# Altium schematic sheet Power_Section.SchDoc
size A; DocumentNumber: 5; SheetNumber: 5; SheetTotal: 13
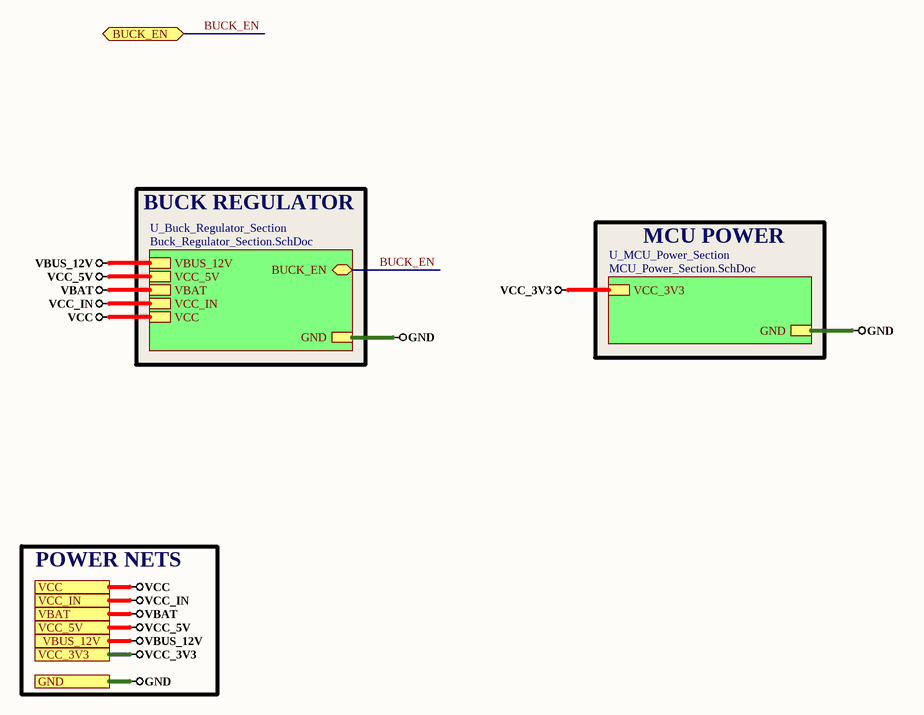
[diagram p0: Power_Section.SchDoc]

## Sub-sheets
U_Buck_Regulator_Section = Buck_Regulator_Section.SchDoc: GND, VBUS_12V, VCC_5V, VBAT, VCC_IN, VCC, BUCK_EN (bidir)
U_MCU_Power_Section = MCU_Power_Section.SchDoc: VCC_3V3, GND

## Ports
BUCK_EN (bidir), GND, VBAT, VBUS_12V, VCC, VCC_3V3, VCC_5V, VCC_IN

## Nets
GND: port GND, sheet U_MCU_Power_Section/GND, sheet U_Buck_Regulator_Section/GND
VBAT: port VBAT, sheet U_Buck_Regulator_Section/VBAT
VBUS_12V: port VBUS_12V, sheet U_Buck_Regulator_Section/VBUS_12V
VCC: port VCC, sheet U_Buck_Regulator_Section/VCC
VCC_3V3: port VCC_3V3, sheet U_MCU_Power_Section/VCC_3V3
VCC_5V: port VCC_5V, sheet U_Buck_Regulator_Section/VCC_5V
VCC_IN: port VCC_IN, sheet U_Buck_Regulator_Section/VCC_IN
BUCK_EN: port BUCK_EN, sheet U_Buck_Regulator_Section/BUCK_EN

## Notes on the sheet
- BUCK REGULATOR
- MCU POWER
- POWER NETS